# EAGLE design AQEM-V1 (EAGLE 9.7.0)
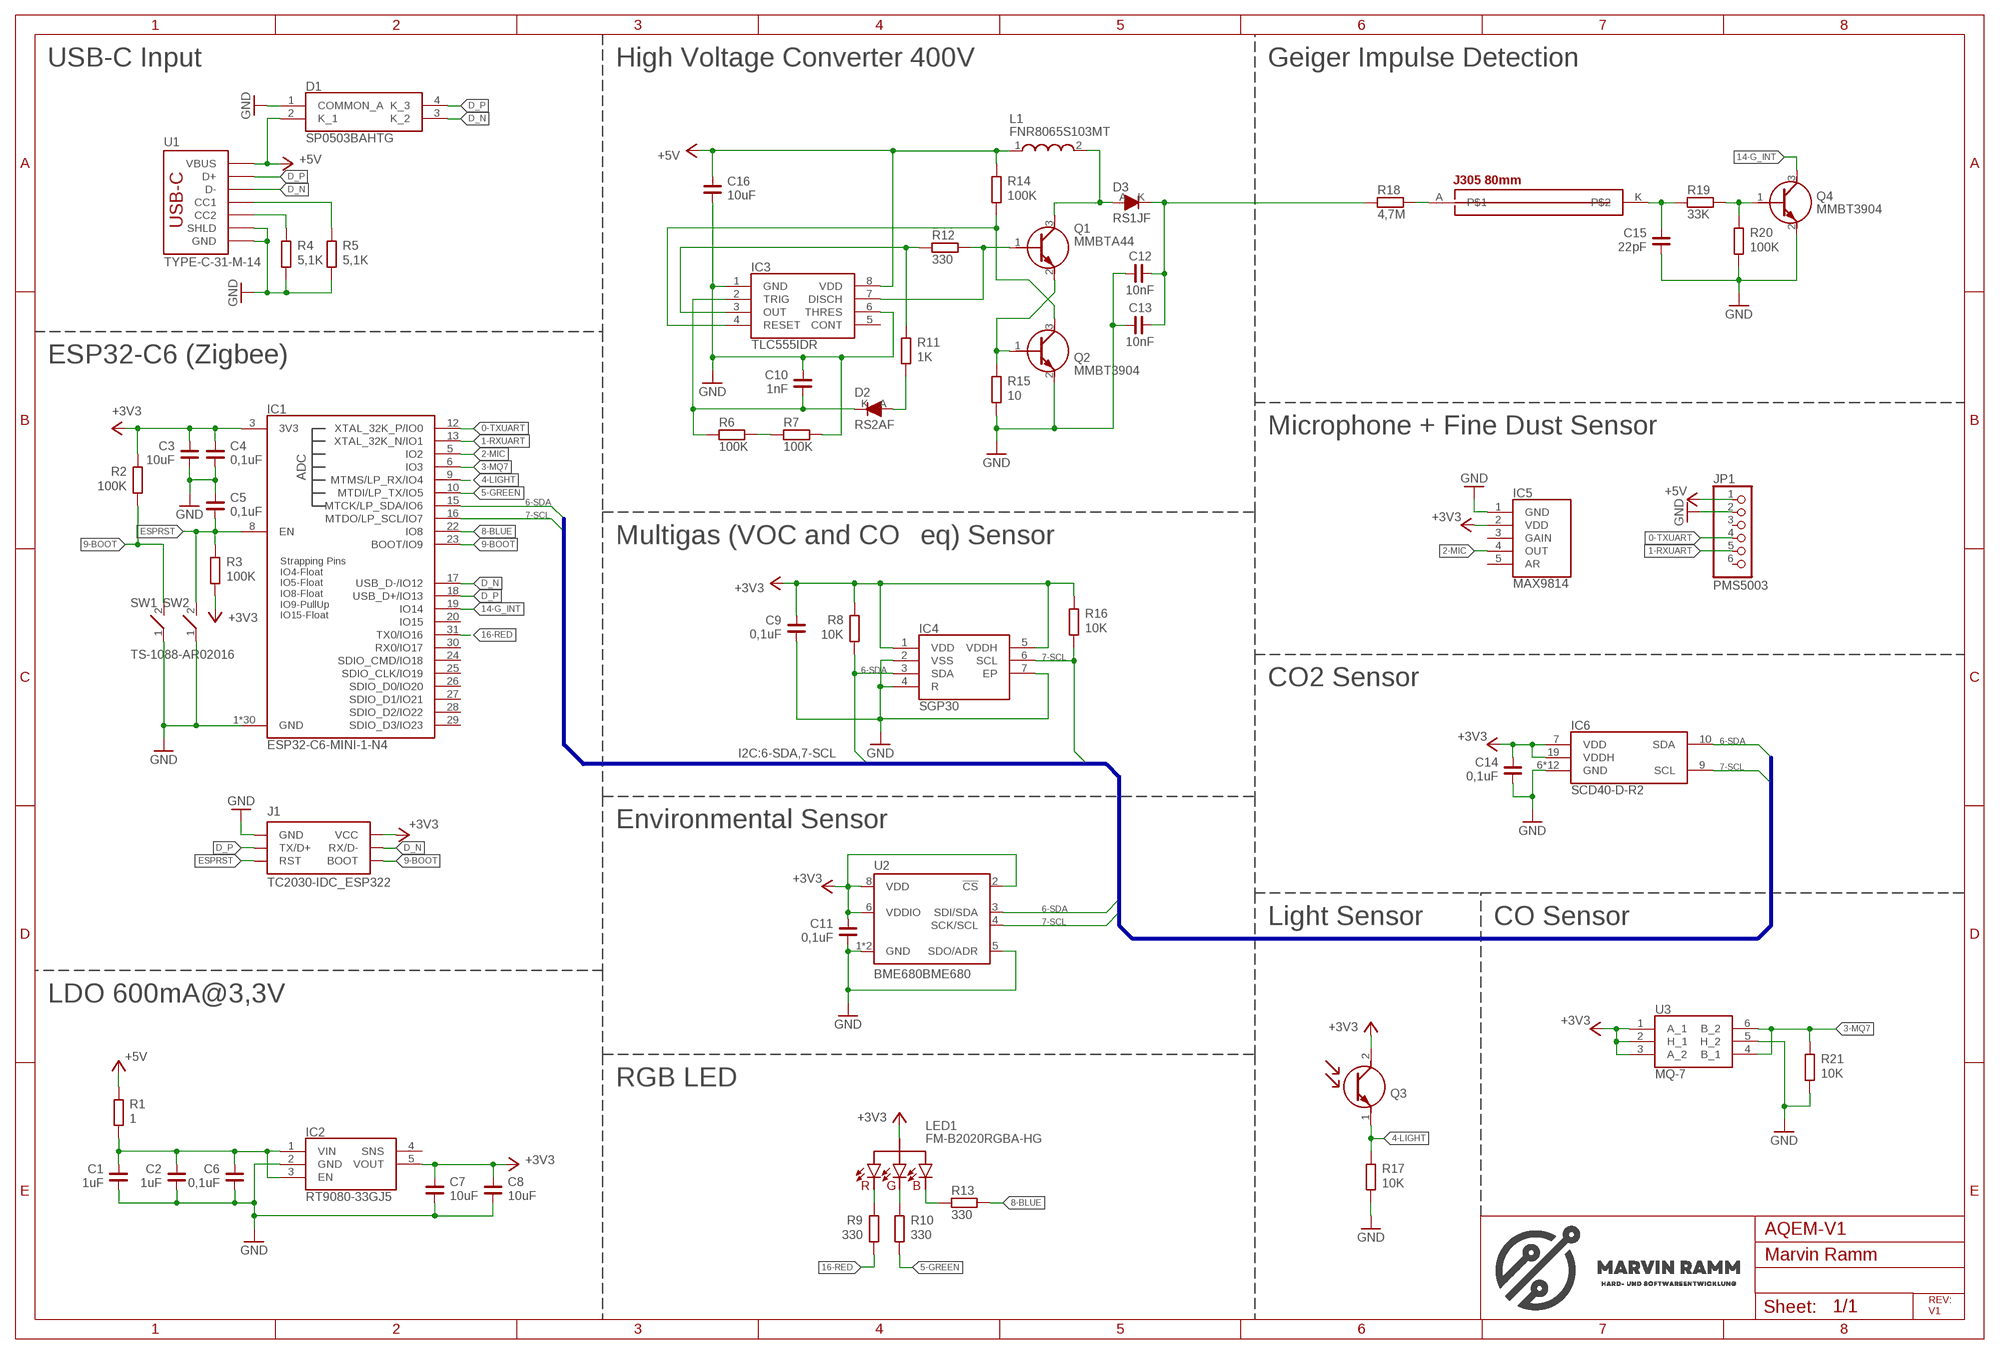
[diagram p0: schematic, sheet 1]

## Parts
C1  1uF  C_900402  [C0402]
C2  1uF  C_900402  [C0402]
C3  10uF  C_900603  [C0603]
C4  0,1uF  C_900402  [C0402]
C5  0,1uF  C_900402  [C0402]
C6  0,1uF  C_900402  [C0402]
C7  10uF  C_900603  [C0603]
C8  10uF  C_900603  [C0603]
C9  0,1uF  C_900402  [C0402]
C10  1nF  C_900402  [C0402]
C11  0,1uF  C_900402  [C0402]
C12  10nF  C_1206  [C1206]
C13  10nF  C_1206  [C1206]
C14  0,1uF  C_900402  [C0402]
C15  22pF  C_900402  [C0402]
C16  10uF  C_900603  [C0603]
D1  SP0503BAHTG  [SP0503BAHTG]
D2  RS2AF  [RS2AF]
D3  RS1JF  [RS2AF]
GC1  J305_80MM  [J305_80MM]
IC1  ESP32-C6-MINI-1-N4  [ESP32C6MINI1N4]
IC2  RT9080-33GJ5  [SOT94P280X100-5N]
IC3  TLC555IDR  [SOIC127P600X175-8N]
IC4  SGP30  [SGP30]
IC5  MAX9814  [MAX9814]
IC6  SCD40-D-R2  [SCD40DR2]
J1  TC2030-IDC_ESP322  [TC2030-IDC-NL]
JP1  PINHD-1X6  [1X06]
L1  FNR8065S103MT  [INDC2016X95N]
LED1  FM-B2020RGBA-HG  [FMB2020RGBAHG]
Q1  MMBTA44  [SOT95P240X105-3N]
Q2  MMBT3904  [SOT95P240X120-3N]
Q3  PT17-21C/L41/TR8  [0805]
Q4  MMBT3904  [SOT95P240X120-3N]
R1  1  R_900603  [R0603]
R2  100K  R_900402  [R0402]
R3  100K  R_900402  [R0402]
R4  5,1K  R_900402  [R0402]
R5  5,1K  R_900402  [R0402]
R6  100K  R_0402  [R0402]
R7  100K  R_0402  [R0402]
R8  10K  R_900402  [R0402]
R9  330  R_900402  [R0402]
R10  330  R_900402  [R0402]
R11  1K  R_900402  [R0402]
R12  330  R_0402  [R0402]
R13  330  R_0402  [R0402]
R14  100K  R_900402  [R0402]
R15  10  R_900402  [R0402]
R16  10K  R_900402  [R0402]
R17  10K  R_900402  [R0402]
R18  4,7M  R_1206  [R1206]
R19  33K  R_0402  [R0402]
R20  100K  R_900402  [R0402]
R21  10K  R_900402  [R0402]
SW1  TS-1088-AR02016  [TS1088AR02016]
SW2  TS-1088-AR02016  [TS1088AR02016]
U1  TYPE-C-31-M-14  [TYPE-C-31-M-14_HRO]
U2  BME680BME680  [LGA3.0X3.0]
U3  MQ-7  [MQ-7]

## Nets
0-TXUART: IC1.12(XTAL_32K_P/IO0) JP1.4
1-RXUART: IC1.13(XTAL_32K_N/IO1) JP1.5
2-MIC: IC1.5(IO2) IC5.4(OUT)
3-MQ7: IC1.6(IO3) R21.1 U3.4(B_1) U3.6(B_2)
4-LIGHT: IC1.9(MTMS/LP_RX/IO4) Q3.1(E) R17.1
5-GREEN: IC1.10(MTDI/LP_TX/IO5) R10.2
6-SDA: IC1.15(MTCK/LP_SDA/IO6) IC4.3(SDA) IC6.10(SDA) R8.2 U2.3(SDI/SDA)
7-SCL: IC1.16(MTDO/LP_SCL/IO7) IC4.6(SCL) IC6.9(SCL) R16.2 U2.4(SCK/SCL)
8-BLUE: IC1.22(IO8) R13.2
9-BOOT: IC1.23(BOOT/IO9) J1.6(BOOT) R2.2 SW1.2(NO)
14-G_INT: IC1.19(IO14) Q4.3(C)
16-RED: IC1.31(TX0/IO16) R9.2
+3V3: C3.2 C4.2 C7.2 C8.2 C9.2 C11.2 C14.2 IC1.3(3V3) IC2.5(VOUT) IC4.1(VDD) IC4.5(VDDH) IC5.2(VDD) IC6.7(VDD) IC6.19(VDDH) J1.2(VCC) LED1.3(VCC) Q3.2(C) R2.1 R3.2 R8.1 R16.1 U2.2(!CS) U2.6(VDDIO) U2.8(VDD) U3.1(A_1) U3.2(H_1) U3.3(A_2)
+5V: C16.2 D1.2(K_1) IC3.8(VDD) JP1.1 L1.1 R1.1 R14.1 U1.A4B9(VBUS) U1.B4A9(VBUS)
D_N: D1.3(K_2) IC1.17(USB_D-/IO12) J1.4(RX/D-) U1.A7(D-) U1.B7(D-)
D_P: D1.4(K_3) IC1.18(USB_D+/IO13) J1.3(TX/D+) U1.A6(D+) U1.B6(D+)
ESPRST: C5.1 IC1.8(EN) J1.5(RST) R3.1 SW2.2(NO)
GND: C1.1 C2.1 C3.1 C4.1 C5.2 C6.1 C7.1 C8.1 C9.1 C10.2 C11.1 C12.1 C13.1 C14.1 C15.1 C16.1 D1.1(COMMON_A) IC1.1(GND) IC1.2(GND) IC1.11(GND) IC1.14(GND) IC1.36(GND) IC1.37(GND) IC1.38(GND) IC1.39(GND) IC1.40(GND) IC1.41(GND) IC1.42(GND) IC1.43(GND) IC1.44(GND) IC1.45(GND) IC1.46(GND) IC1.47(GND) IC1.48(GND) IC1.49(GND) IC1.50(GND) IC1.51(GND) IC1.52(GND) IC1.53(GND) IC1.54(GND) IC1.55(GND) IC1.56(GND) IC1.57(GND) IC1.58(GND) IC1.59(GND) IC1.60(GND) IC1.61(GND) IC2.2(GND) IC3.1(GND) IC3.6(THRES) IC4.2(VSS) IC4.4(R) IC4.7(EP) IC5.1(GND) IC6.6(GND) IC6.20(GND) IC6.21(GND) IC6.P$1(GND) IC6.P$2(GND) IC6.P$3(GND) IC6.P$4(GND) IC6.P$5(GND) IC6.P$6(GND) IC6.P$7(GND) IC6.P$8(GND) IC6.P$9(GND) J1.1(GND) JP1.2 Q2.2(E) Q4.2(E) R4.2 R5.2 R7.2 R15.2 R17.2 R20.2 R21.2 SW1.1(COM) SW2.1(COM) U1.A1B12(GND) U1.B1A12(GND) U1.P$33(SHLD) U1.P$34(SHLD) U1.P$35(SHLD) U1.P$36(SHLD) U2.1(GND) U2.5(SDO/ADR) U2.7(GND) U3.5(H_2)
HV+: C12.2 C13.2 D3.K R18.1
N$1: C1.2 C2.2 C6.2 IC2.1(VIN) IC2.3(EN) R1.2
N$2: Q1.2(E) Q2.1(B) R15.1
N$3: R4.1 U1.B5(CC2)
N$4: R5.1 U1.A5(CC1)
N$5: LED1.2(B) R13.1
N$6: IC3.7(DISCH) Q1.1(B) R12.2
N$7: D2.A R11.2
N$8: IC3.4(RESET) Q2.3(C) R14.2
N$9: D3.A L1.2 Q1.3(C)
N$10: IC3.3(OUT) R11.1 R12.1
N$11: C10.1 D2.K IC3.2(TRIG) R6.1
N$12: R6.2 R7.1
N$13: GC1.A R18.2
N$14: C15.2 GC1.K R19.1
N$16: Q4.1(B) R19.2 R20.1
N$19: LED1.1(R) R9.1
N$20: LED1.4(G) R10.1
Unconnected: IC1.20(IO15) IC1.24(SDIO_CMD/IO18) IC1.25(SDIO_CLK/IO19) IC1.26(SDIO_D0/IO20) IC1.27(SDIO_D1/IO21) IC1.28(SDIO_D2/IO22) IC1.29(SDIO_D3/IO23) IC1.30(RX0/IO17) IC2.4(SNS) IC3.5(CONT) IC5.3(GAIN) IC5.5(AR) JP1.3 JP1.6

## Buses
I2C:6-SDA,7-SCL

## Notes on the sheet
- USB-C Input | High Voltage Converter 400V | Geiger Impulse Detection
- ESP32-C6 (Zigbee)
- Microphone + Fine Dust Sensor
- Multigas (VOC and CO₂eq) Sensor
- PMS5003
- CO2 Sensor
- Environmental Sensor
- Light Sensor | CO Sensor
- LDO 600mA@3,3V
- RGB LED
- Marvin Ramm
- REV:
  V1

## Library data of the parts
C1-C11 C14-C16 = rc-master-smd:C_90: NON-POLARIZED CAP
C12 C13 = rc-master-smd:C_: NON-POLARIZED CAP
D1 = SP0503BAHTG:SP0503BAHTG: ESD Suppressors / TVS Diodes TVS AVAL DIODE SMT Source: Datasheet <https://nl.mouser.com/datasheet/2/240/Littelfuse_TVS_Diode_Array_SP05_Datasheet.pdf-777043.pdf>; ARROW_PART_NUMBER: SP0503BAHTG; ARROW_PRICE-STOCK: https://www.arrow.com/en/products/sp0503bahtg/littelfuse?region=nac; DESCRIPTION: ESD Suppressors / TVS Diodes TVS AVAL DIODE SMT; HEIGHT: 1.22mm; MANUFACTURER_NAME: LITTELFUSE; MANUFACTURER_PART_NUMBER: SP0503BAHTG; MOUSER_PART_NUMBER: 576-SP0503BAHTG; MOUSER_PRICE-STOCK: https://www.mouser.co.uk/ProductDetail/Littelfuse/SP0503BAHTG?qs=uD%2FdkN7XIa0NTYXwHdELYA%3D%3D
D2 = BAT60AE6327HTSA1:RS2AF: 50A 150ns 50V Independent 1.3V@2A 2A SMAF Single Diodes ROHS
D3 = BAT60AE6327HTSA1:RS1JF: 30A 250ns 600V Independent 1.3V 1A SMAF Single Diodes ROHS
GC1 = Eigene Library:J305_80MM
IC1 = ESP32-C6-MINI-1-N4:ESP32-C6-MINI-1-N4: Multiprotocol Modules ESP32-C6 Module, supports Wi-Fi 6 in 2.4 GHz band, Bluetooth 5, Zigbee 3.0 and Thread - -40 to 105C Source: Datasheet <https://www.espressif.com/sites/default/files/documentation/esp32-c6-mini-1_mini-1u_datasheet_en.pdf>; DESCRIPTION: Multiprotocol Modules ESP32-C6 Module, supports Wi-Fi 6 in 2.4 GHz band, Bluetooth 5, Zigbee 3.0 and Thread - -40 to 105C; HEIGHT: mm; MANUFACTURER_NAME: Espressif Systems; MANUFACTURER_PART_NUMBER: ESP32-C6-MINI-1-N4; MOUSER_PART_NUMBER: 356-ESP32C6MINI-1-N4; MOUSER_PRICE-STOCK: https://www.mouser.co.uk/ProductDetail/Espressif-Systems/ESP32-C6-MINI-1-N4?qs=Jm2GQyTW%2FbjiJX9bVadqSw%3D%3D
IC2 = RT9080-33GJ5:RT9080-33GJ5: IC REG LIN 3.3V 600MA TSOT23-5 Source: Datasheet <https://www.richtek.com/assets/product_file/RT9080/DS9080-05.pdf>; DESCRIPTION: IC REG LIN 3.3V 600MA TSOT23-5; HEIGHT: 1mm; MANUFACTURER_NAME: RICHTEK; MANUFACTURER_PART_NUMBER: RT9080-33GJ5; MOUSER_PART_NUMBER: 835-RT9080-33GJ5; MOUSER_PRICE-STOCK: https://www.mouser.co.uk/ProductDetail/Richtek/RT9080-33GJ5?qs=amGC7iS6iy9hJG6yuLjyPQ%3D%3D
IC3 = TLC555IDR:TLC555IDR: TLC555IDR, Timer 2MHz, 3 ??? 15 V, 8-Pin SOIC-8 Source: Datasheet <https://datasheet.datasheetarchive.com/originals/distributors/Datasheets-302/21491.pdf>; ARROW_PART_NUMBER: TLC555IDR; ARROW_PRICE-STOCK: https://www.arrow.com/en/products/tlc555idr/texas-instruments?region=nac; DESCRIPTION: TLC555IDR, Timer 2MHz, 3 ??? 15 V, 8-Pin SOIC-8; HEIGHT: 1.75mm; MANUFACTURER_NAME: Texas Instruments; MANUFACTURER_PART_NUMBER: TLC555IDR; MOUSER_PART_NUMBER: 595-TLC555IDR; MOUSER_PRICE-STOCK: https://www.mouser.co.uk/ProductDetail/Texas-Instruments/TLC555IDR?qs=gb35HGp1gQLSMPEbAnVEPg%3D%3D
IC4 = SGP30:SGP30: Indoor Air Quality Sensor for TVOC and CO2eq Measurements 1.8V , 48mA , 2.45 x 2.45 x 0.9 mm Source: Datasheet <https://sensirion.com/media/documents/984E0DD5/61644B8B/Sensirion_Gas_Sensors_Datasheet_SGP30.pdf>; DESCRIPTION: Indoor Air Quality Sensor for TVOC and CO2eq Measurements 1.8V , 48mA , 2.45 x 2.45 x 0.9 mm; HEIGHT: 0.9mm; MANUFACTURER_NAME: Sensirion; MANUFACTURER_PART_NUMBER: SGP30
IC5 = MAX9814:MAX9814
IC6 = SCD40-D-R2:SCD40-D-R2: Air Quality Sensor CO2 Sensor 2.5V/3.3V/5V 20-Pin SMD EP Source: Datasheet <https://www.arrow.com/en/products/scd40-d-r2/sensirion-ag>; ARROW_PART_NUMBER: SCD40-D-R2; ARROW_PRICE-STOCK: https://www.arrow.com/en/products/scd40-d-r2/sensirion-ag?utm_currency=USD&region=nac; DESCRIPTION: Air Quality Sensor CO2 Sensor 2.5V/3.3V/5V 20-Pin SMD EP; HEIGHT: 6.8mm; MANUFACTURER_NAME: Sensirion; MANUFACTURER_PART_NUMBER: SCD40-D-R2; MOUSER_PART_NUMBER: 403-SCD40-D-R2; MOUSER_PRICE-STOCK: https://www.mouser.co.uk/ProductDetail/Sensirion/SCD40-D-R2?qs=HBWAp0VN4RjIKW%252BlMeZn1w%3D%3D
J1 = TC20XX:TC2030-IDC_ESP32: “No Legs” 6-pin Plug-of-Nails™ Cable fitted with a 6-pin 0.1″ pitch ribbon connector.
JP1 = pinhead:PINHD-1X6: PIN HEADER
L1 = SRN2009T-6R8M:FNR8065S103MT: 150mA 10mH Magnetic Shielded Inductor ±20% 230mA 27.36Ω SMD,8x8mm Fixed Inductors ROHS
LED1 = FM-B2020RGBA-HG:FM-B2020RGBA-HG: Light Emitting Diodes (LED) RGB 615~630nm Red, 515~535nm Green, 465~480nm Blue 35~85mcd@8mARed,100~260mcd@5mAGreen,15~40mcd@3mABlue Top View 2020 RoHS Source: Datasheet <https://datasheet.lcsc.com/szlcsc/Foshan-NationStar-Optoelectronics-FM-B2020RGBA-HG_C108793.pdf>
Q1 = MMBTA44-G:MMBTA44: Bipolar Transistors - BJT NPN TRANSISTOR 200MA 400V Source: Datasheet <https://componentsearchengine.com/Datasheets/1/MMBTA44-G.pdf>; ARROW_PART_NUMBER: MMBTA44-G; ARROW_PRICE-STOCK: https://www.arrow.com/en/products/mmbta44-g/comchip-technology; DESCRIPTION: Bipolar Transistors - BJT NPN TRANSISTOR 200MA 400V; HEIGHT: 1.05mm; MANUFACTURER_NAME: Comchip Technology; MANUFACTURER_PART_NUMBER: MMBTA44-G; MOUSER_PART_NUMBER: 750-MMBTA44-G; MOUSER_PRICE-STOCK: https://www.mouser.co.uk/ProductDetail/Comchip-Technology/MMBTA44-G?qs=LLUE9lz1YbcZd%2FLg0rW76w%3D%3D
Q2 Q4 = MMBT3904:MMBT3904: Transistor GP BJT NPN 40V 0.2A SOT23 Fairchild MMBT3904 NPN Bipolar Transistor, 0.2 A, 40 V, 3-Pin SOT-23 Source: Datasheet <https://media.digikey.com/pdf/Data Sheets/ON Semiconductor PDFs/2N3904,MMBT3904,PZT3904.pdf>; ARROW_PART_NUMBER: MMBT3904; ARROW_PRICE-STOCK: https://www.arrow.com/en/products/mmbt3904/on-semiconductor; DESCRIPTION: Transistor GP BJT NPN 40V 0.2A SOT23 Fairchild MMBT3904 NPN Bipolar Transistor, 0.2 A, 40 V, 3-Pin SOT-23; HEIGHT: 1.2mm; MANUFACTURER_NAME: ON Semiconductor; MANUFACTURER_PART_NUMBER: MMBT3904; MOUSER_PART_NUMBER: 512-MMBT3904; MOUSER_PRICE-STOCK: https://www.mouser.co.uk/ProductDetail/ON-Semiconductor-Fairchild/MMBT3904?qs=UMEuL5FsraCg3xKjS4uBJQ%3D%3D
Q3 = Eigene Library:PT17-21C/L41/TR8
R1-R5 R8-R11 R14-R17 R20 R21 = rc-master-smd:R_90: RESISTOR
R6 R7 R12 R13 R18 R19 = rc-master-smd:R_: RESISTOR
SW1 SW2 = TS-1088-AR02016:TS-1088-AR02016: Tact Switch Source: Datasheet <https://www.xunpudianzi.com/uploads/pdf/TS-1088-ARXXX.pdf>; DESCRIPTION: Tact Switch; HEIGHT: 2mm; MANUFACTURER_NAME: XUNPU; MANUFACTURER_PART_NUMBER: TS-1088-AR02016
U1 = TYPE-C-31-M-12:TYPE-C-31-M-14; BUILT_BY: EMA_Cory; COPYRIGHT: Copyright (C) 2018 Accelerated Designs. All rights reserved; DATASHEET: https://datasheet.lcsc.com/szlcsc/1811101526_Korean-Hroparts-Elec-TYPE-C-31-M-14_C223907.pdf; MANUFACTURER_PART_NUMBER: TYPE-C-31-M-14; SOURCELIBRARY: HRO_Parts_Electronics_2020-03-18; VENDOR: HRO Electronics
U2 = SparkFun-Sensors:BME680: Bosch BME680 – Combined Humidity and Pressure Sensor The BME680 is as combined digital humidity, pressure and temperature sensor based on proven sensing principles. The sensor module is housed in an extremely compact metal-lid LGA package with a footprint of only 3.0×3.0mm with a height of 0.93mm. Its small dimensions and its low power consumption allow the implementation in battery driven devices such as handsets, GPS modules or watches.
U3 = MQ-7:MQ-7: Air Quality Sensors CO Gas Sensor Source: Datasheet <http://www.mouser.com/ds/2/321/605-00007-MQ-7-Datasheet-370460.pdf>; DESCRIPTION: Air Quality Sensors CO Gas Sensor; HEIGHT: mm; MANUFACTURER_NAME: Parallax; MANUFACTURER_PART_NUMBER: 605-00007; MOUSER_PART_NUMBER: 619-605-00007; MOUSER_PRICE-STOCK: https://www.mouser.co.uk/ProductDetail/Parallax/605-00007?qs=c8dSG9xvwkfF75xDV5Xgeg%3D%3D

## Board
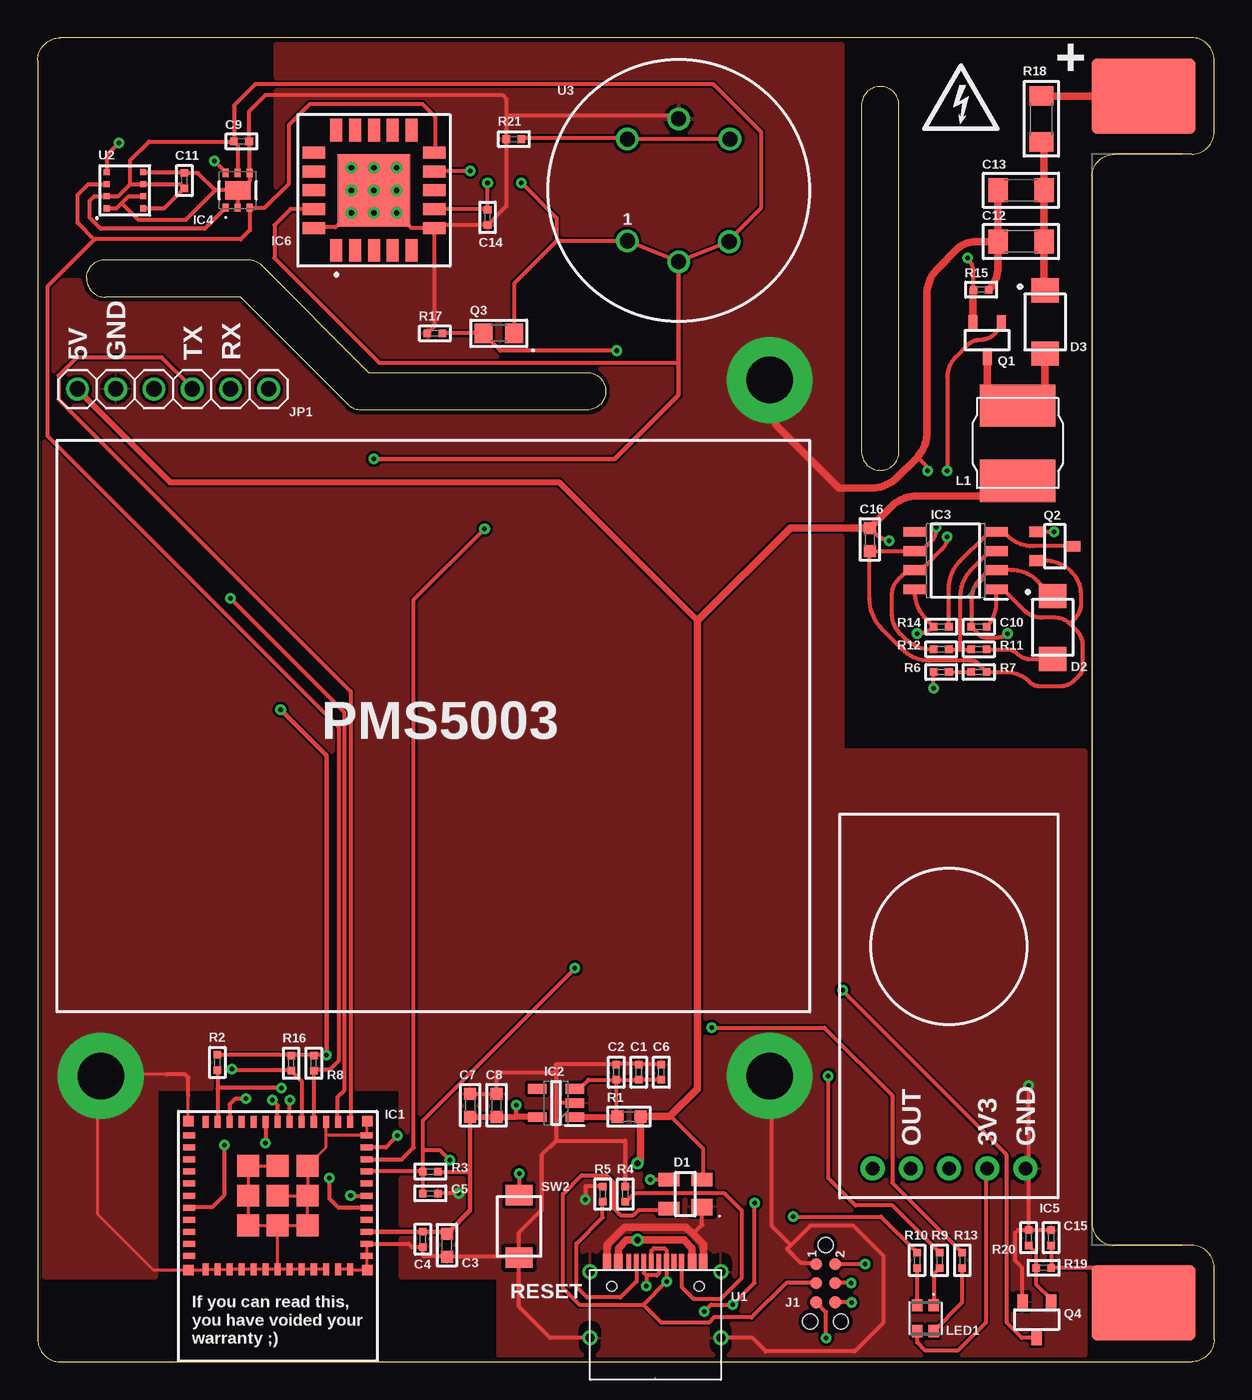
[diagram p1: board, top side]
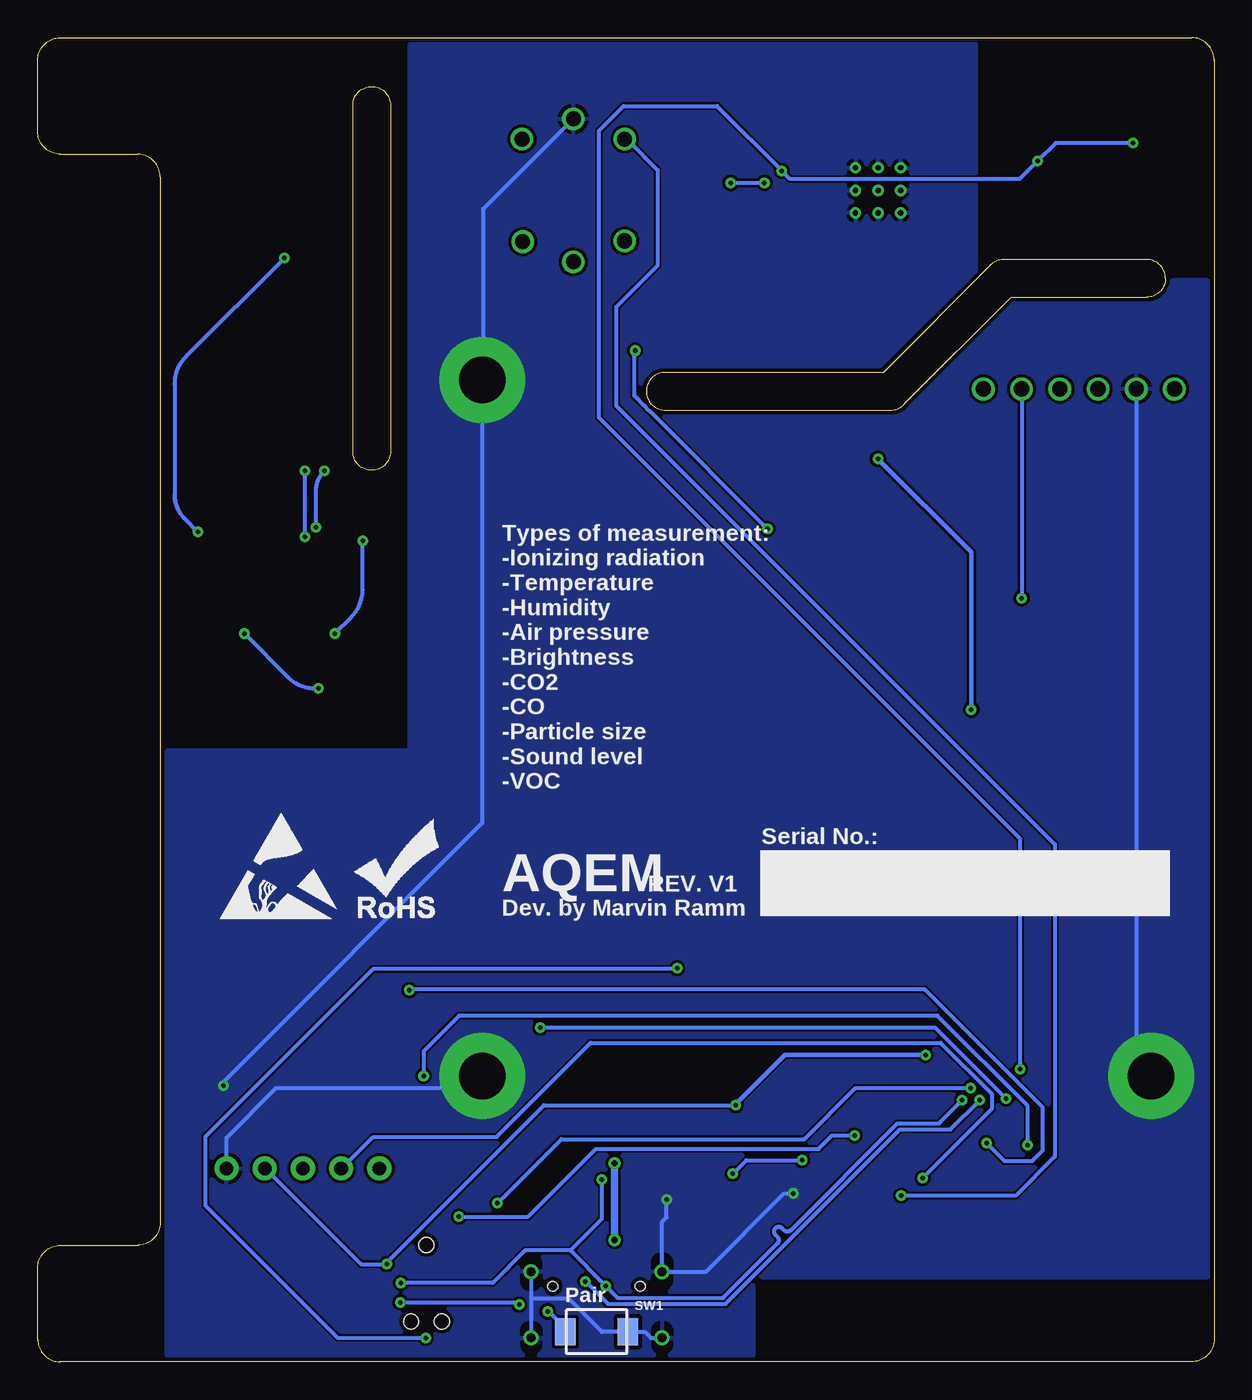
[diagram p2: board, bottom side, seen from below]

Size 78.2 x 88 mm. Coordinates in mm from the lower left corner, seen from the top.
Outline: 1.5,0 76.7,0 arc90 78.2,1.5 78.2,6.25 arc90 76.7,7.75 71.55,7.75 arc-90 70.05,9.25 70.05,78.75 arc-90 71.55,80.25 76.7,80.25 arc90 78.2,81.75 78.2,86.5 arc90 76.7,88 1.5,88 arc90 0,86.5 0,1.5 arc90 1.5,0
Outline: 3.25,72 arc90 4.5,70.75 13.5,70.75 20.55,63.7 arc51 21.5,63.25 36.5,63.25 arc90 37.75,64.5 arc90 36.5,65.75 22,65.75 14.75,73 arc25 14.35,73.2 arc14 13.95,73.25 4.5,73.25 arc90 3.25,72
Outline: 56,84.75 arc90 54.75,83.5 54.75,60.5 arc90 56,59.25 arc90 57.25,60.5 57.25,83.5 arc90 56,84.75
Copper layers (1*16): Top / Bottom
Stack-up Default Layer Stack: Top User Defined 0.018mm / Dielectric-1 User Defined 1.53mm / Bottom User Defined 0.018mm
Design rules: minimum copper width 0.2mm, minimum drill size 0.3mm, copper clearance wire_polygon to pad_smd 0.2mm, copper clearance wire_polygon to via 0.2mm, copper clearance pad_smd to pad_smd 0.2mm, copper clearance pad_smd to via 0.2mm, copper clearance via to via 0.2mm, copper clearance smd to pad (same net) 0.2mm, copper clearance smd to via (same net) 0.2mm, copper clearance smd to smd (same net) 0.2mm, copper clearance wire_polygon to wire_polygon 0.15mm, dimension clearance 0.3mm, via restrict clearance 0mil, restrict clearance 0mil, drill distance 0.25mm, keepout clearance 0mil
RestrictTop: area 0,0 to 30.5,5.5; area 8,5.5 to 24,18; area 17.2,72.7 to 27.5,83
RestrictBottom: area 0,0 to 30.5,5.5

### Footprints (pad centres in the part's own frame; a part is rotated, then mirrored left to right if it is on the bottom)
C0402 = smd 0.5 x 0.5: 1 -0.508,0; 2 0.508,0
C0603 = smd 0.8 x 0.8: 1 -0.762,0; 2 0.762,0
C1206 = smd 1.3 x 1.6: 1 -1.524,0; 2 1.524,0
SP0503BAHTG = smd 1.1 x 1.4: 1 -0.85,-1.1 | smd 0.9 x 1.4: 2 0.95,-1.1; 3 0.95,1.1; 4 -0.95,1.1
RS2AF = smd 1.6 x 1.8: A 3.95,1.35; K -0.25,1.35
J305_80MM = smd 6.9 x 5: A 3.45,3.1; K 3.45,-77.1
ESP32C6MINI1N4 = smd 0.8 x 0.4: 1 -5.9,4; 2 -5.9,3.2; 3 -5.9,2.4; 4 -5.9,1.6; 5 -5.9,0.8; 6 -5.9,0; 7 -5.9,-0.8; 8 -5.9,-1.6; 9 -5.9,-2.4; 10 -5.9,-3.2; 11 -5.9,-4; 25 5.9,-4; 26 5.9,-3.2; 27 5.9,-2.4; 28 5.9,-1.6; 29 5.9,-0.8; 30 5.9,0; 31 5.9,0.8; 32 5.9,1.6; 33 5.9,2.4; 34 5.9,3.2; 35 5.9,4 | smd 0.4 x 0.8: 12 -4.8,-4.9; 13 -4,-4.9; 14 -3.2,-4.9; 15 -2.4,-4.9; 16 -1.6,-4.9; 17 -0.8,-4.9; 18 0,-4.9; 19 0.8,-4.9; 20 1.6,-4.9; 21 2.4,-4.9; 22 3.2,-4.9; 23 4,-4.9; 24 4.8,-4.9; 36 4.8,4.9; 37 4,4.9; 38 3.2,4.9; 39 2.4,4.9; 40 1.6,4.9; 41 0.8,4.9; 42 0,4.9; 43 -0.8,4.9; 44 -1.6,4.9; 45 -2.4,4.9; 46 -3.2,4.9; 47 -4,4.9; 48 -4.8,4.9 | smd 1.45 x 1.45: 49 0,0; 54 -1.975,1.975; 55 -1.975,0; 56 -1.975,-1.975; 57 0,-1.975; 58 1.975,-1.975; 59 1.975,0; 60 1.975,1.975; 61 0,1.975 | smd 0.7 x 0.7: 50 5.95,4.95; 51 5.95,-4.95; 52 -5.95,-4.95; 53 -5.95,4.95
SOT94P280X100-5N = smd 1.25 x 0.65: 1 -1.25,0.94; 2 -1.25,0; 3 -1.25,-0.94; 4 1.25,-0.94; 5 1.25,0.94
SOIC127P600X175-8N = smd 1.528 x 0.65: 1 -2.711,1.905; 2 -2.711,0.635; 3 -2.711,-0.635; 4 -2.711,-1.905; 5 2.711,-1.905; 6 2.711,-0.635; 7 2.711,0.635; 8 2.711,1.905
SGP30 = smd 0.55 x 0.4: 1 -1.15,0.8; 2 -1.15,0; 3 -1.15,-0.8; 4 1.15,-0.8; 5 1.15,0; 6 1.15,0.8 | smd 1.25 x 1.7: 7 0,0
MAX9814 = drill 0.9 pad 1.6: 1 0,0; 2 2.54,0; 3 5.08,0; 4 7.62,0; 5 10.16,0
SCD40DR2 = smd 1.5 x 0.8: 1 -4,2.5; 2 -4,1.25; 3 -4,0; 4 -4,-1.25; 5 -4,-2.5; 11 4,-2.5; 12 4,-1.25; 13 4,0; 14 4,1.25; 15 4,2.5 | smd 0.8 x 1.5: 6 -2.5,-4; 7 -1.25,-4; 8 0,-4; 9 1.25,-4; 10 2.5,-4; 16 2.5,4; 17 1.25,4; 18 0,4; 19 -1.25,4; 20 -2.5,4 | smd 4.8 x 4.8: 21 0,0 | drill 0.35: P$1 -1.5,0; P$2 0,0; P$3 1.5,0; P$4 -1.5,-1.5; P$5 0,-1.5; P$6 1.5,-1.5; P$7 -1.5,1.5; P$8 0,1.5; P$9 1.5,1.5
TC2030-IDC-NL = smd 0.787 x 0.787: 1 0,-1.27; 2 0,0; 3 1.27,-1.27; 4 1.27,0; 5 2.54,-1.27; 6 2.54,0 | hole 0.991: -1.27,-0.635; 3.81,0.381; 3.81,-1.651
1X06 = drill 1.016: 1 -6.35,0; 2 -3.81,0; 3 -1.27,0; 4 1.27,0; 5 3.81,0; 6 6.35,0
INDC2016X95N = smd 2.8 x 5: 1 -2.4,0.22; 2 2.6,0.22
FMB2020RGBAHG = smd 0.8 x 0.7: 1 0.85,-0.55; 2 -0.85,-0.55; 3 -0.85,0.55; 4 0.85,0.55
SOT95P240X105-3N = smd 1.1 x 0.6: 1 -1.1,0.95; 2 -1.1,-0.95; 3 1.1,0
SOT95P240X120-3N = smd 1 x 0.7: 1 -1.2,0.95; 2 -1.2,-0.95; 3 1.2,0
0805 = smd 1.2 x 1.3: 1 -1.016,0; 2 1.016,0
R0603 = smd 0.8 x 0.8: 1 -0.762,0; 2 0.762,0
R0402 = smd 0.5 x 0.5: 1 -0.508,0; 2 0.508,0
R1206 = smd 1.3 x 1.6: 1 -1.524,0; 2 1.524,0
TS1088AR02016 = smd 1.35 x 1.8: 1 -2.075,0; 2 2.075,0
TYPE-C-31-M-14_HRO = smd 0.559 x 1.092: A1B12 -3.21,4; A4B9 -2.46,4; B1A12 3.19,4; B4A9 2.44,4 | smd 0.305 x 1.092: A5 -1.26,4; A6 -0.26,4; A7 0.24,4; A8 1.24,4; B5 1.74,4; B6 0.74,4; B7 -0.76,4; B8 -1.76,4 | drill 0.6 pad 1 slot 1.4 rotated 90: P$33 4.35,-1.05; P$36 -4.35,-1.05 | drill 0.6 pad 1 slot 1.7 rotated 90: P$34 4.35,3.35; P$35 -4.35,3.35 | hole 0.65: -2.89,2.39; 2.91,2.39
LGA3.0X3.0 = smd 0.4 x 0.4: 1 -1.2,1.2; 2 -0.4,1.2; 3 0.4,1.2; 4 1.2,1.2; 5 1.2,-1.2; 6 0.4,-1.2; 7 -0.4,-1.2; 8 -1.2,-1.2
MQ-7 = drill 1 pad 1.5: 1 -3.41,-3.36; 2 0,-4.75; 3 3.36,-3.41; 4 3.41,3.41; 5 0,4.75; 6 -3.41,3.41

### Placement (x,y rotation side)
C1  39.95,19.25 270 top
C2  38.45,19.25 270 top
C3  27.2,7.75 90 top
C4  25.6,8.15 90 top
C5  26.1,11.2 0 top
C6  41.45,19.25 270 top
C7  28.75,17.05 270 top
C8  30.5,17.05 270 top
C9  13.55,81.1 180 top
C10  62.55,48.85 0 top
C11  9.75,78.5 270 top
C12  65.35,74.45 0 top
C13  65.35,77.85 0 top
C14  29.9,76.05 90 top
C15  67.35,8.25 270 top
C16  55.3,54.65 90 top
D1  43.05,11.15 90 top
D2  66.1,50.65 270 top
D3  65.6,70.95 270 top
GC1  70.05,81.02 0 top
IC1  15.96,11.05 180 top
IC2  34.45,17.2 180 top
IC3  61,53.25 180 top
IC4  13.3,77.85 90 top
IC5  65.65,12.85 180 top
IC6  22.35,77.85 90 top
J1  53,6.5 270 top
JP1  9,64.65 0 top
L1  65.35,60.95 90 top
LED1  59,2.9 90 top
Q1  63.1,67.9 270 top
Q2  67.6,54.2 0 top
Q3  30.65,68.35 0 top
Q4  66.4,2.8 270 top
R1  39.3,16.3 180 top
R2  11.95,19.9 270 top
R3  26.1,12.65 0 top
R4  39.05,11.15 90 top
R5  37.55,11.15 90 top
R6  60.05,45.85 0 top
R7  62.55,45.85 0 top
R8  18.35,19.85 270 top
R9  59.95,6.75 90 top
R10  58.45,6.75 90 top
R11  62.55,47.35 0 top
R12  60.05,47.35 180 top
R13  61.45,6.75 90 top
R14  60.05,48.85 0 top
R15  62.7,71.25 0 top
R16  16.85,19.85 270 top
R17  26.4,68.35 180 top
R18  66.7,82.6 90 top
R19  66.85,6.25 180 top
R20  65.85,8.25 90 top
R21  31.65,81.25 180 top
SW1  41.05,2 180 bottom
SW2  32,9 90 top
U1  41.05,2.64 0 top
U2  5.8,77.85 90 top
U3  42.6,77.85 0 top

### Tracks (layer width: path | path; a pad name or v marks a point on that pad's centre or on a via)
0-TXUART
  Top 0.25: IC1.12 20.8,16 20.8,44.55 1.4,63.95 1.4,65.55 2.6,66.75 8.25,66.75 10.2,64.8 JP1.4
1-RXUART  (via drill 0.3)
  Top 0.25: IC1.13 19.95,17.6 20.4,18.05 20.4,43.15 v12.8,50.75
  Bottom 0.25: JP1.5 12.8,64.64 v12.8,50.75
2-MIC  (via drill 0.3)
  Top 0.25: IC1.5 20,10.25 19.4,10.85 v19.4,12.2
  Bottom 0.25: v19.4,12.2 14.8,16.8 14.8,17.8 18.2,21.2 41.45,21.2 47.7,14.95 55.9,14.95 58,12.85 IC5.4
3-MQ7  (via drill 0.3)
  Top 0.25: U3.4 U3.6 39.14,81.3 32.17,81.3 R21.1 | v20.8,11.05 IC1.6
  Bottom 0.25: v20.8,11.05 13.2,11.05 10.6,13.65 10.6,34.4 39.75,63.55 39.75,70.1 37,72.85 37,79.2 39,81.2 U3.6
4-LIGHT  (via drill 0.3)
  Top 0.25: R17.1 Q3.1 29.63,68.32 30.75,67.2 v38.5,67.2 | IC1.9 24.2,13.45 25,14.25 25,50.65 v29.7,55.34 v29.7,55.35
  Bottom 0.25: v38.5,67.2 38.55,67.15 38.55,64.2 37.83,63.48 37.69,63.31 37.52,63.17 v29.7,55.35
5-GREEN  (via drill 0.3)
  Top 0.25: v50.2,9.65 56.05,9.65 58.4,7.3 58.44,7.3 R10.2 | v23.9,15.05 v23.9,15.04 23.15,14.25 IC1.10
  Bottom 0.25: v50.2,9.65 45.6,9.65 41.1,14.15 26.3,14.15 25.4,15.05 v23.9,15.05
6-SDA
  Top 0.25: IC1.15 R8.2 18.4,19.4 19.4,19.4 20,20 20,42.19 0.65,61.54 0.65,71.45 3.77,74.58 | U2.3 3.35,78.25 2.65,77.55 2.65,75.7 3.77,74.58 | IC6.10 26.4,80.4 26.4,82.75 25.55,83.6 18.1,83.6 16.7,82.2 16.7,78.3 15.1,76.7 IC4.3 14.1,75.2 13.5,74.6 3.8,74.6 3.77,74.58
7-SCL  (via drill 0.3)
  Top 0.25: IC1.16 17.56,18.63 R16.2 16.8,19.4 12.95,19.4 v12.9,19.45 | v5.4,81 4.6,80.2 U2.4 | IC4.6 12.5,79.05 v11.75,79.8 | v28.75,79.15 26.4,79.15 IC6.9
  Bottom 0.25: v5.4,81 10.55,81 v11.75,79.8 12.95,78.6 28.2,78.6 v28.75,79.15 33.05,83.45 39.25,83.45 40.9,81.8 40.9,62.75 12.9,34.75 v12.9,19.45
8-BLUE  (via drill 0.3)
  Top 0.25: R13.2 56.8,11.9 56.8,17.7 52.3,22.2 v44.8,22.2 | v13.85,17.5 13.15,17.5 12.75,17.1 IC1.22
  Bottom 0.25: v44.8,22.2 18.55,22.2 v13.85,17.5
9-BOOT  (via drill 0.3)
  Top 0.25: R2.2 11.96,18.2 | 11.96,18.2 IC1.23 | v54.1,3.95 J1.6 | v44.3,3.35 44.75,3.8 v46.2,3.8 47.65,5.25 v47.65,10.55 | v16.2,18.2 11.96,18.2
  Bottom 0.25: v54.1,3.95 46.35,3.95 v46.2,3.8 | v44.3,3.35 44.25,3.35 43.12,2.23 SW1.2 | v16.2,18.2 23.85,18.2 27.25,14.8 43.4,14.8 v47.65,10.55
14-G_INT  (via drill 0.3)
  Top 0.25: v15.15,14.55 IC1.19 | v53.5,24.7 53.5,24.65 64.4,13.75 64.4,2.6 65.4,1.6 Q4.3
  Bottom 0.25: v53.5,24.7 53.45,24.75 19.25,24.75 11.4,16.9 11.4,14.05 12.1,13.35 13.95,13.35 v15.15,14.55
16-RED  (via drill 0.3)
  Top 0.25: R9.2 56.81,10.4 54.35,10.4 52.55,12.2 v52.55,19 | v12.4,14.4 12.38,14.38 12.38,11.06 11.59,10.28 10.08,10.28 IC1.31
  Bottom 0.25: v52.55,19 52.55,20.65 50.2,23 18.39,23 12.4,17 v12.4,14.4
+3V3  (via drill 0.3)
  Top 0.25: U2.8 8.41,76.65 C11.2 9.49,78.25 U2.6 6.15,78.25 | 6.15,78.25 5.35,77.45 U2.2 3.75,77.45 3.45,77.15 3.45,76.05 4.2,75.3 11.1,75.3 IC4.1 | IC6.7 29.8,76.6 C14.2 v29.9,78.35 | 18.8,76.6 IC6.19 16.8,76.6 15.75,75.55 15.75,73.35 22.7,66.4 42.6,66.4 | 6.15,78.25 6.15,79.85 7.4,81.1 C9.2 | 34.49,74.49 31.67,71.67 Q3.2 | 34.49,74.49 U3.1 U3.2 U3.3 46,74.6 48.1,76.7 48.1,81.7 44.9,84.9 14.45,84.9 13.05,83.5 C9.2 | R2.1 12,20.4 16.8,20.4 R16.1 17,20.4 18.2,20.4 R8.1 18.4,20.4 v19.2,20.4 | 28.75,12.6 26.8,12.6 R3.2 | v55,6.5 J1.2 | LED1.3 58.45,1.3 59,0.75 61.15,0.75 63,2.6 63,12.8 IC5.2 | 33.2,16.4 IC2.5 | C9.2 13.3,80.84 IC4.5 | v32.15,78.35 34.49,76.01 34.49,74.49
  Top 0.305: C7.2 28.75,12.6 28.75,10.06 C3.2 27.05,8.66 C4.2 IC1.3 | 31.8,16.29 v31.8,17.05 | v19.2,20.4 19.2,40.3 v16.15,43.35 | v22.35,60 38.35,60 42.6,64.25 42.6,66.4 U3.2
  Top 0.406: C7.2 C8.2 31.8,16.29 33.17,16.29 IC2.5
  Bottom 0.25: IC5.2 63,12.8 56.7,6.5 v55,6.5 55,6.6 44.55,17.05 v31.8,17.05 | v32.15,78.35 v29.9,78.35
  Bottom 0.305: v31.8,17.05 31.8,17.15 28.55,20.4 v19.2,20.4 | v16.15,43.35 16.15,53.8 v22.35,60
+5V  (via drill 0.3, 0.4)
  Top 0.25: IC3.8 58.29,51.16 arc45 59.03,49.36 R14.1 arc-45 v58.46,48.4 v58.45,48.4 | v56.6,54.56 56.53,54.63 arc-45 55.77,54.95 C16.2 | D1.2 44.2,12.15 44.2,14.2 42.2,16.2 42,16.3
  Top 0.406: 64.4,57.8 65.13,58.53 | 65.13,58.53 L1.1 | 43.85,49.25 34.65,58.45 8.8,58.45 2.65,64.6 JP1.1 | 65.05,57.8 65.15,57.7 65.15,58.51 65.13,58.53
  Top 0.508: 65.15,58.51 64.19,57.55 58.49,57.55 arc45 56.69,56.81 C16.2 50.01,55.41 43.85,49.25 43.85,18.15 42,16.3 R1.1 40.06,13.41 v39.85,13.2 | U1.A4B9 38.59,7.54 39.15,8.1 v39.85,8.1 | v39.85,8.1 42.95,8.1 43.49,7.56 U1.B4A9 | v39.85,8.1
  Bottom 0.25: v58.45,48.4 57.34,49.51 arc-45 56.6,51.3 v56.6,54.56
  Bottom 0.508: v39.85,8.1 v39.85,13.2
D_N  (via drill 0.3)
  Top 0.25: U1.A7 41.29,5.89 41.15,5.75 40.45,5.75 | 40.45,5.75 40.29,5.91 U1.B7 | 40.45,5.75 v40.45,5.05 | IC1.17 v16.76,17.39 v16.75,17.4 | v54.05,5.25 53,5.25 J1.4 | v40.7,12.1 41.9,12.1 41.95,12.05 D1.3
  Bottom 0.25: v16.75,17.4 18.3,15.85 21.05,15.85 28.15,8.75 arc90 28.59,8.75 28.73,8.88 arc-90 29.17,8.88 arc-90 29.17,8.44 29.03,8.31 arc90 29.03,7.87 32.65,4.25 39.65,4.25 v40.45,5.05 42.8,7.4 | v54.05,5.25 47.95,5.25 45.8,7.4 42.8,7.4 | v40.7,12.1 40.7,9.5 42.8,7.4
D_P  (via drill 0.3)
  Top 0.25: U1.A6 40.79,7.39 40.95,7.55 41.65,7.55 41.8,7.4 U1.B6 v41.79,5.36 v41.8,5.35 40.25,3.8 | IC1.18 15.96,17.04 v15.6,17.4 | J1.3 51.71,5.25 49.75,5.25 47.45,2.95 44.95,2.95 44.6,2.6 41.45,2.6 40.25,3.8 | D1.4 41.85,10.1 39.95,10.1 39.6,9.75 38.75,9.75 38.3,10.2 38.3,11.9 37.8,12.4 36.15,12.4 34.9,11.15 34.9,4.9 36,3.8 40.25,3.8
  Bottom 0.25: v41.8,5.35 40.3,3.85 32.48,3.85 20.88,15.45 17.53,15.45 15.6,17.38 v15.6,17.4
ESPRST  (via drill 0.3)
  Top 0.25: R3.1 IC1.8 | R3.1 C5.1 | J1.5 52.4,3.3 v52.4,1.6 | v35.7,26.15 25.6,16.05 25.6,14.05 | 25.6,14.05 25.6,12.8 R3.1 | v32,12.5 SW2.2 | v27.4,13.4 26.75,14.05 25.6,14.05
  Bottom 0.25: v52.4,1.6 58.25,1.6 67.05,10.4 67.05,14.97 55.92,26.1 35.75,26.1 v35.7,26.15 | v32,12.5 31.1,13.4 v27.4,13.4
GND  (via drill 0.3, 3.1 pad 5.7)
  Top 0.2: IC1.2 21.86,7.07 IC1.1 | IC1.1 21.86,6.15 IC1.53 20.81,6.1 IC1.48 IC1.47 | IC1.46 IC1.45 IC1.44 IC1.43 IC1.42 | IC1.42 IC1.41 IC1.40 IC1.39 IC1.38 IC1.37 IC1.36 11.11,6.1 IC1.50 7.7,6.1 4,9.8 4,18.8 v4.2,19 4.3,19.1 8.55,19.1 8.6,19.1 | IC1.61 IC1.60 IC1.59 IC1.58 15.78,13.03 15.8,13 | IC1.61 IC1.54 17.93,10.93 18,11 | IC1.55 17.88,11 16,11 | 18,11.2 17.93,11.27 IC1.56 19.16,14.25 19.16,15.05 | 19.16,15.05 IC1.14 | 19.16,15.05 IC1.11 21.86,15.95 IC1.52 | IC1.51 10.01,17.69 | IC1.42 IC1.61
  Top 0.25: C10.2 arc45 63.71,50.43 IC3.1 64.02,51.34 arc-45 64.25,51.25 65.55,49.95 arc45 66.76,49.45 67.63,49.45 arc-45 68.6,49.05 | 68.6,49.05 69.06,48.59 arc-45 69.45,47.65 69.45,46.13 arc-45 69.25,45.65 68.89,45.29 arc-45 67.95,44.9 66.62,44.9 arc-45 65.9,45.2 arc45 64.33,45.85 R7.2 62.49,46.42 arc45 62.05,46.6 59.25,46.6 arc-45 57.46,47.34 56.13,48.67 arc-45 55.29,50.7 C16.1 55.39,53.81 | 68.6,49.05 68.93,49.38 arc45 69.35,50.4 69.35,51 arc45 68.75,52.45 68.69,52.51 arc45 66.9,53.25 Q2.2 | U2.5 7.04,79.01 C11.1 9.8,79 10.65,79 11.8,77.85 | U2.1 5.25,76.65 5.6,77 | 5.6,77 6.05,77.45 U2.7 | C15.1 R20.2 | Q4.2 65.4,4 65.4,6.3 64.95,6.75 64.95,8.55 65.16,8.76 R20.2 | R20.2 65.85,12.78 IC5.1 65.85,13.05 v65.85,18.35 | 50.05,7.75 48.8,9 48.8,19 v48.65,19 | J1.1 51.6,6.6 50.7,6.6 49.8,7.5 50.05,7.75 | v28,11.2 C5.2 | v36.4,10.8 36.4,11.66 R5.2 | U1.P$34 | 44.4,6.6 U1.B1A12 | C2.1 38.6,19.8 39.8,19.8 C1.1 40,19.8 41.4,19.8 C6.1 | C7.1 28.8,17.8 30.4,17.8 C8.1 30.5,19.25 34.45,19.25 | C2.1 | 18,13.2 IC1.56 18,13 | 15.8,13 IC1.57 | 18,11 IC1.55 18,11.2 | 14,11 IC1.59 14,11.2 | 16,11 IC1.49 | 14,13 IC1.58 | IC1.1 | 21.85,7.8 22,7.8 IC1.2 24.65,7.85 24.86,7.64 C4.1 25.6,7.05 25.65,7 C3.1 | C3.1 32,7 | C3.1 | U1.P$36 34.06,1.59 32,3.65 SW2.1 32,7 | 32,7 32,8.6 33.5,10.1 33.5,13.75 34.45,14.7 | 50.05,7.75 51.35,9.05 54.2,9.05 56.23,7.03 56.23,2.62 54.3,0.7 48.4,0.7 47.51,1.59 U1.P$33 | IC6.P$2 22.25,77.85 19.8,75.4 18.4,75.4 IC6.20 | IC6.P$7 21,76.4 IC6.P$2 | IC6.P$1 22.2,76.4 21.6,77 IC6.P$2 | 24,77.8 24,76.4 | 24,76.4 IC6.P$4 24,76.2 | IC6.P$8 21,77.8 21.6,77.2 IC6.P$2 | 22.4,77.8 IC6.P$2 | 24,77.8 IC6.P$5 24,78 24,79.2 IC6.P$6
  Top 0.25: 24,77.8 IC6.P$2 | 22.2,79.4 21,79.4 IC6.P$9 | 22.2,79.4 IC6.P$3 | 22.2,79.4 IC6.P$2 | 55.4,53.8 55.39,53.81 | 55.39,53.81 C16.1 arc45 C16.1 IC3.6 arc45 59.05,54.2 59.45,54.6 arc45 59.7,55.2 v59.7,55.45 | 58.36,60.01 58.6,60 58.97,59.63 arc-45 v59.15,59.2 | IC4.7 11.8,77.85 | IC4.7 13.2,78 13.6,78 14.1,78.5 IC4.4 14.1,81.07 C9.1 14.06,83.11 15.15,84.2 30.89,84.2 31.14,83.93 R21.2 | 5.6,77 6.7,75.9 9.85,75.9 11.8,77.85 | 25.9,75.1 25.9,75.5 26.05,75.5 26.2,75.35 IC6.6 | IC6.6 26.2,75.2 | C14.1 26.59,75.54 26.35,75.3 | C14.1 | R21.2 | U3.5 42.4,82.8 31.14,82.8 R21.2 | 34.45,19.25 34.45,17.2 | IC2.2 34.45,17.2 | 34.45,17.2 34.45,14.7 | C2.1 34.45,19.76 34.45,19.25 | 43.55,8.5 44.15,9.1 44.15,10.25 | 44.15,10.25 D1.1 | 44.35,10.25 44.15,10.25 | U1.A1B12 37.84,6.39 | 36.7,5.95 U1.P$35 | 34.45,14.7 39.05,14.7 R4.2 | IC4.7 IC4.2 | IC6.6 24.85,75.35 24,76.2 | 24,76.2 24,76.4 | IC6.6 26.35,75.3 | 26.35,75.3 26.35,68.81 R17.2 | R21.2 31.14,76.79 C14.1 | 10.01,17.69 10.01,18.89 9.8,19.1 8.55,19.1
  Top 0.508: C13.1 C12.1 | R15.2 arc45 63.83,72.74 C12.1 | U1.A1B12 37.84,7.79 39,8.95 43.1,8.95 43.55,8.5 44.24,7.81 U1.B1A12 | C12.1 62.38,74.45 arc45 61.05,73.9 59.84,72.69 arc45 59.1,70.9 59.1,61.8 arc-45 58.36,60.01 57.14,58.79 arc-45 55.35,58.05 53.25,58.05 49.39,61.91 arc-45 48.65,63.7 v48.65,65.25
  Bottom 0.25: IC5.1 65.65,14.9 62.35,18.2 49.6,18.2 48.8,19 v48.65,19 | U1.P$34 45.4,4.2 | 45.4,4.2 U1.P$33 | v28,11.2 28.6,11.2 33.8,6 36.6,6 U1.P$35 36.7,9.3 36.4,9.6 v36.4,10.8 | U1.P$36 37.45,1.59 37.85,1.99 SW1.1 40.7,2 42.9,4.2 45.4,4.2 | U3.5 48.6,76.6 48.6,65.4 v48.65,65.25 48.65,35.8 65.85,18.6 v65.85,18.35 | v59.7,55.45 59.7,57.87 arc45 v59.15,59.2 | JP1.2 5.19,19.99 v4.2,19
  pour Top: 0,72 14.05,72 21.45,64.6 53.6,64.6 53.6,40.75 69.75,40.75 69.75,0 0,0
  pour Bottom: 0,72 14.05,72 21.45,64.6 53.6,64.6 53.6,40.75 69.75,40.75 69.75,0 0,0
  pour Top: 53.6,64.3 53.6,88 15.7,88 15.7,64.3
  pour Bottom: 15.7,88 53.6,88 53.6,64.2 15.7,64.2
HV+
  Top 0.508: R18.1 arc-45 66.87,80.66 C13.2 C12.2 66.87,71.38 arc45 D3.K
N$1
  Top 0.25: C2.2 38.47,18.75 39.93,18.75 C1.2 C6.2 | 35.8,18 IC2.3 36,18.14 36.6,18.74 C2.2 | C2.2 38.45,16.39 R1.2
  Top 0.406: IC2.1 38.5,16.26 R1.2
N$2  (via drill 0.3)
  Top 0.25: R15.1 62.19,72.4 arc45 v61.8,73.35 | v67.55,55.15 Q2.1
  Top 0.508: Q1.2 62.15,71.25 R15.1
  Bottom 0.25: v61.8,73.35 68.36,66.79 arc-45 69.1,65 69.1,57.6 arc-45 68.46,56.06 v67.55,55.15
N$3
  Top 0.25: R4.1 39.1,10.65 39.65,11.2 45.65,11.2 46.8,10.05 46.8,5.6 45.4,4.2 43.6,4.2 42.8,5 42.8,6.6 U1.B5
N$4
  Top 0.25: R5.1 37.55,9.6 35.8,7.85 35.8,5 36.52,4.28 38.73,4.28 39.8,5.35 39.8,6.6 U1.A5
N$5
  Top 0.25: LED1.2 61.45,3.95 R13.1
N$6  (via drill 0.3)
  Top 0.25: Q1.1 arc-45 63.87,68.57 63.66,68.36 arc-45 62.55,67.9 arc45 61.87,67.62 60.99,66.74 arc45 60.45,65.44 v60.45,59.2 | v60.45,54.84 arc-45 60.11,54.01 59,52.9 arc-45 58.31,52.62 IC3.7 58.26,52.62 arc45 57.5,52.3 57.17,51.97 arc45 56.75,50.95 56.75,49.73 arc45 57.3,48.4 57.61,48.09 arc45 59.4,47.35 R12.2
  Bottom 0.25: v60.45,59.2 v60.45,54.84
N$7
  Top 0.25: R11.2 64.45,47.35 arc-45 65.05,47.1 arc45 66.02,46.7 D2.A
N$8
  Top 0.25: Q2.3 66.14,54.2 arc-45 64.45,54.9 arc45 63.83,55.16 IC3.4 63.62,55.16 arc45 63,54.9 61.3,53.2 arc45 60.56,51.41 R14.2
N$9
  Top 0.508: Q1.3 63.1,63.5 65.13,63.5 | 65.13,63.5 L1.2 | D3.A 66.95,63.5 65.13,63.5
N$10
  Top 0.25: R12.1 61.3,47.35 | 61.3,47.35 R11.1 | IC3.3 arc45 62.98,53.58 62.04,52.64 arc45 61.3,50.85 61.3,47.35
N$11  (via drill 0.3)
  Top 0.25: D2.K 66.48,51.87 arc45 64.68,52.62 IC3.2 arc45 62.86,52.26 62.65,52.05 arc45 62.04,50.58 C10.1 62.59,48.3 arc45 62.95,48.15 63.85,48.15 arc45 v64.45,48.4 | v59.55,44.75 arc-45 59.54,44.77 R6.1
  Bottom 0.25: v64.45,48.4 61.54,45.49 arc-45 59.75,44.75 v59.55,44.75
N$12
  Top 0.25: R6.2 R7.1
N$13
  Top 0.508: GC1.A 66.72,84.12 arc-45 R18.2
N$14
  Top 0.25: C15.2 R19.1 71.17,6.25 GC1.K
N$16
  Top 0.25: Q4.1 67.35,4.15 66.34,5.16 R19.2 66.34,7.25 R20.1
N$19
  Top 0.25: R9.1 59.55,5.84 LED1.1
N$20
  Top 0.25: LED1.4 R10.1

### Text on the board
SilkscreenTop: + | 5V | GND | TX | RX | PMS5003 | OUT | 3V3 | GND | RESET | If you can read this, / you have voided your / warranty ;)
SilkscreenBottom: Types of measurement: / -Ionizing radiation / -Temperature / -Humidity / -Air pressure / -Brightness / -CO2 / -CO / -Particle size / -Sound level / -VOC | Serial No.: | REV. V1 | AQEM | Dev. by Marvin Ramm | Pair